# Altium schematic sheet MCU_Power_Sec.SchDoc
size A4; DocumentNumber: 6; SheetNumber: 6; SheetTotal: 9
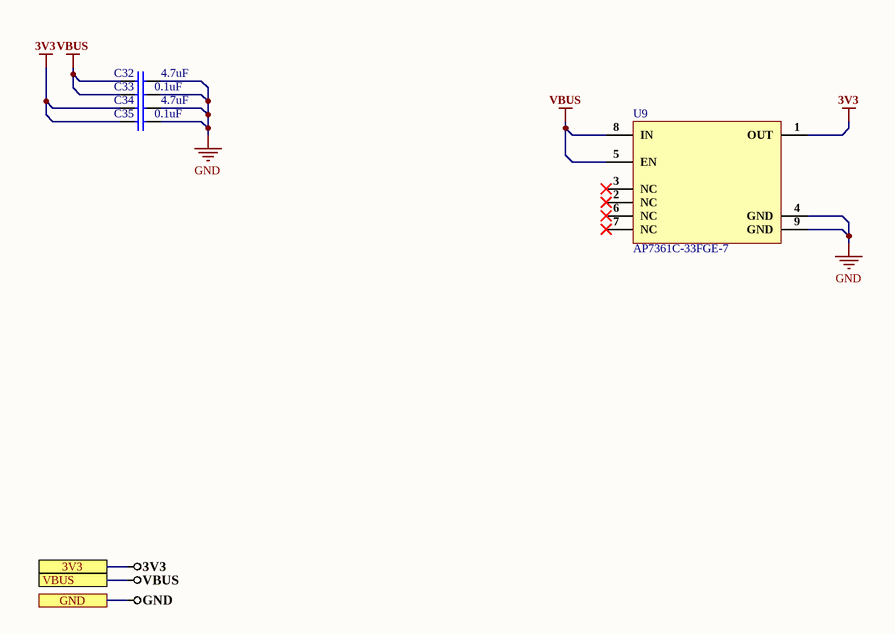
[diagram p0: MCU_Power_Sec.SchDoc]

## Parts
C32  4.7uF  [Cap 0402]
C33  0.1uF  [CAP 0201]
C34  4.7uF  [Cap 0402]
C35  0.1uF  [CAP 0201]
U9  AP7361C-33FGE-7  [U-DFN3030-8]

## Ports
3V3, GND, VBUS

## Nets
3V3: C34.1 C35.1 U9.1(OUT) ; port 3V3
GND: C32.2 C33.2 C34.2 C35.2 U9.4(GND) U9.9(GND) ; port GND
VBUS: C32.1 C33.1 U9.5(EN) U9.8(IN) ; port VBUS

Not connected (* = marked no-connect by the designer): U9 2(NC)* 3(NC)* 6(NC)* 7(NC)*

## Library data of the parts
C32 C34 = CL05A475MO5NUNC: Cap Ceramic 4.7uF 16V X5R 20% SMD 0402 85C T/R; Manufacturer: Samsung; Supplier 1: Avnet; Manufacturer Part Number: CL05A475MO5NUNC; RoHS: Yes; Category: Ceramic Capacitors; Pricing 1: 1=0.63800, 25=0.44600, 100=0.26800, 250=0.23400, 500=0.20000, 1000=0.16900 (USD); Mount: Surface Mount; Case/Package: 0402; Case Code (Metric): 1005; Case Code (Imperial): 0402; Min Operating Temperature: -55°C; Max Operating Temperature: 85°C; Packaging: Tape and Reel; Capacitance: 4.7uF; Voltage Rating: 16V; Tolerance: 20%; Length: 0.039inch; Width: 0.02inch; Thickness: 0.022inch; RoHS Compliant: Yes; ComponentLink1URL: http://www.farnell.com/datasheets/2710653.pdf?src-supplier=Farnell; ComponentLink1Description: http://www.farnell.com/datasheets/2710653.pdf?src-supplier=Farnell; ComponentLink2URL: http://www.farnell.com/datasheets/2710653.pdf?src-supplier=Newark; ComponentLink2Description: http://www.farnell.com/datasheets/2710653.pdf?src-supplier=Newark; ComponentLink3URL: http://www.samsungsem.com/kr/support/product-search/mlcc/CL05A475MO5NUNC.jsp?src-supplier=Digi-Key; ComponentLink3Description: http://www.samsungsem.com/kr/support/product-search/mlcc/CL05A475MO5NUNC.jsp?src-supplier=Digi-Key; Supplier Part Number 1: 82AC9197
C33 C35 = GRM033R61E104KE14D: CAP CER 0.1UF 25V X5R 0201; Manufacturer: Murata; Capacitance: 100nF; Tolerance: 10%; Supplier 1: Mouser; Manufacturer Part Number: GRM033R61E104KE14D; RoHS: Yes; Category: Ceramic Capacitors; Stock 1: 22478; Pricing 1: 1=0.10000, 10=0.03100, 50=0.03100, 100=0.02500, 1000=0.01700, 10000=0.01400 (USD); Mount: Surface Mount; Case/Package: 0201; Case Code (Metric): 0603; Case Code (Imperial): 0201; Weight: 1.2E-05oz; Min Operating Temperature: -55°C; Max Operating Temperature: 85°C; Packaging: Tape and Reel; Voltage Rating: 25V; Dielectric: X5R; Termination: SMD/SMT; Resistor Type: Ceramic; Voltage Rating (DC): 25V; Package Quantity: 15000; Length: 0.024inch; Width: 0.012inch; Height: 0.3mm; Thickness: 0.013inch; Lead Free: Lead Free; RoHS Compliant: Yes; ComponentLink1URL: http://www.farnell.com/datasheets/2867843.pdf?src-supplier=Farnell; ComponentLink1Description: http://www.farnell.com/datasheets/2867843.pdf?src-supplier=Farnell; ComponentLink2URL: http://www.mouser.com/ds/2/281/c02e-2905.pdf?src-supplier=Mouser; ComponentLink2Description: http://www.mouser.com/ds/2/281/c02e-2905.pdf?src-supplier=Mouser; ComponentLink3URL: http://search.murata.co.jp/Ceramy/image/img/A01X/G101/ENG/GRM033R61E104KE14-01.pdf?src-supplier=Digi-Key; ComponentLink3Description: http://search.murata.co.jp/Ceramy/image/img/A01X/G101/ENG/GRM033R61E104KE14-01.pdf?src-supplier=Digi-Key; ComponentLink4URL: http://www.farnell.com/datasheets/2867843.pdf?src-supplier=Newark; ComponentLink4Description: http://www.farnell.com/datasheets/2867843.pdf?src-supplier=Newark; Supplier Part Number 1: 81-GRM033R61E104KE4D
U9 = AP7361C-33FGE-7: IC REG LINEAR 3.3V 1A UDFN3030-8; Manufacturer: Diodes; Dropout Voltage: 360mV; Number of Regulators: 1; Min Current Limit: 1.1A; Supplier 1: Digi-Key; Manufacturer Part Number: AP7361C-33FGE-7; RoHS: Yes; Category: Voltage Regulators - Linear; Stock 1: 84; Pricing 1: 1=0.56000, 10=0.48100, 25=0.44880, 100=0.35910, 250=0.33348, 500=0.28218, 1000=0.21804 (USD); Mount: Surface Mount; Min Operating Temperature: -40°C; Max Operating Temperature: 85°C; Packaging: Tape and Reel; Output Voltage: 3.3V; Output Current: 1A; RoHS Compliant: Yes; ComponentLink1URL: http://www.mouser.com/ds/2/115/AP7361C-775034.pdf?src-supplier=Mouser; ComponentLink1Description: http://www.mouser.com/ds/2/115/AP7361C-775034.pdf?src-supplier=Mouser; ComponentLink2URL: https://www.diodes.com/assets/Datasheets/AP7361C.pdf?src-supplier=Digi-Key; ComponentLink2Description: https://www.diodes.com/assets/Datasheets/AP7361C.pdf?src-supplier=Digi-Key; Supplier Part Number 1: AP7361C-33FGE-7DICT-ND